# Altium schematic sheet USBPower.SchDoc (part 1 of 2)
size A4; SheetNumber: 6; SheetTotal: 7
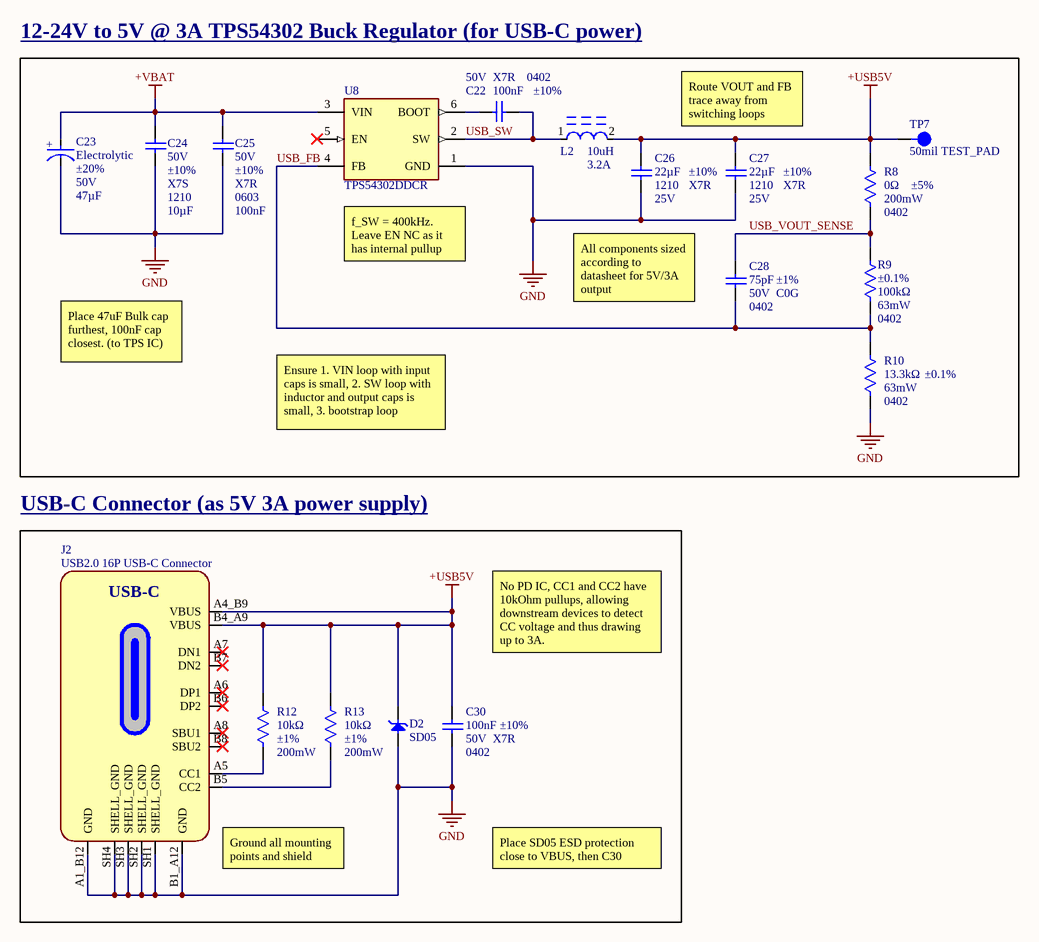
[diagram p0: USBPower.SchDoc]

## Parts
C22  Case/Package: 0402  Voltage Rating: 50V  Dielectric: X7R  Tolerance: ±10%  [0402_Cap]  (hidden comment: 100nF)
C23  Dielectric: Electrolytic  Tolerance: ±20%  Voltage Rating: 50V  [ELECTROLYTIC_CAP]  (hidden comment: 47µF)
C24  Voltage Rating: 50V  Tolerance: ±10%  Dielectric: X7S  Case/Package: 1210  Capacitance: 10µF  [1210_CAP]  (hidden comment: 10uF)
C25  Voltage Rating: 50V  Tolerance: ±10%  Dielectric: X7R  Case/Package: 0603  [0603_CAP]  (hidden comment: 100nF)
C26  Dielectric: X7R  Voltage: 25V  Tolerance: ±10%  Case/Package: 1210  Capacitance: 22µF  [1210_CAP]  (hidden comment: 22uF)
C27  Dielectric: X7R  Voltage: 25V  Tolerance: ±10%  Case/Package: 1210  Capacitance: 22µF  [1210_CAP]  (hidden comment: 22uF)
C28  Dielectric Material: C0G  Voltage Rating: 50V  Tolerance: ±1%  Case/Package: 0402  [0402_Cap]  (hidden comment: 75pF)
C30  Case/Package: 0402  Voltage Rating: 50V  Dielectric: X7R  Tolerance: ±10%  [0402_Cap]  (hidden comment: 100nF)
D2  SD05  [DIO_MM3Z3V0T1G]
J2  USB2.0 16P USB-C Connector  [USBC_GCT_USB4105-GF-A-060]
L2  10uH  Current Rating: 3.2A  [FP-SRN6045TA-MFG]
R8  Tolerance: ±5%  Power Rating: 200mW  Case/Package: 0402  Resistance: 0Ω  [0402_RES]  (hidden comment: 0R)
R9  Tolerance: ±0.1%  Resistance: 100kΩ  Max Power Dissipation: 63mW  Case Code (Imperial): 0402  [0402_RES]  (hidden comment: 100K)
R10  Tolerance: ±0.1%  Max Power Dissipation: 63mW  Case/Package: 0402  Resistance: 13.3kΩ  [0402_RES]  (hidden comment: 13K3)
R12  Tolerance: ±1%  Power Rating: 200mW  Resistance: 10kΩ  [0402_RES]  (hidden comment: 10K)
R13  Tolerance: ±1%  Power Rating: 200mW  Resistance: 10kΩ  [0402_RES]  (hidden comment: 10K)
TP7  50mil TEST_PAD  [15mil_TEST_PAD]
U8  TPS54302DDCR  [FP-DDC0006A-MFG]

## Blocks framed on the sheet
12-24V to 5V @ 3A TPS54302 Buck Regulator (for USB-C power): C22-C28 L2 R8-R10 TP7 U8
USB-C Connector (as 5V 3A power supply): C30 D2 J2 R12 R13

## Nets
+USB5V: C26.2 C27.2 C30.2 D2.K J2.A4_B9(VBUS) J2.B4_A9(VBUS) L2.2 R8.2 R12.2 R13.2 TP7.1
+VBAT: C23.1(A) C24.2 C25.2 U8.3(VIN)
GND: C23.2(C) C24.1 C25.1 C26.1 C27.1 C30.1 D2.A J2.A1_B12(GND) J2.B1_A12(GND) J2.SH1(SHELL_GND) J2.SH2(SHELL_GND) J2.SH3(SHELL_GND) J2.SH4(SHELL_GND) R10.1 U8.1(GND)
USB_FB: C28.1 R9.1 R10.2 U8.4(FB)
USB_SW: C22.1 L2.1 U8.2(SW)
USB_VOUT_SENSE: C28.2 R8.1 R9.2
NetC22_2: C22.2 U8.6(BOOT)
NetJ2_A5: J2.A5(CC1) R12.1
NetJ2_B5: J2.B5(CC2) R13.1

Not connected (* = marked no-connect by the designer): J2 A6(DP1)* A7(DN1)* A8(SBU1)* B6(DP2)* B7(DN2)* B8(SBU2)*; U8 5(EN)*

## Notes on the sheet
- Route VOUT and FB trace away from switching loops
- (near U8) f_SW = 400kHz. Leave EN NC as it has internal pullup
- All components sized according to datasheet for 5V/3A output
- Place 47uF Bulk cap furthest, 100nF cap closest. (to TPS IC)
- Ensure 1. VIN loop with input caps is small, 2. SW loop with inductor and output caps is small, 3. bootstrap loop
- No PD IC, CC1 and CC2 have 10kOhm pullups, allowing downstream devices to detect CC voltage and thus drawing up to 3A.
- (near J2) Ground all mounting points and shield
- Place SD05 ESD protection close to VBUS, then C30
- (in symbol 865080645012) +
- (in symbol USB4105-GF-A-060) USB-C